# EAGLE design rotor_khamex_3.4 (EAGLE 7.6.0)

## Sheet 1 of 3
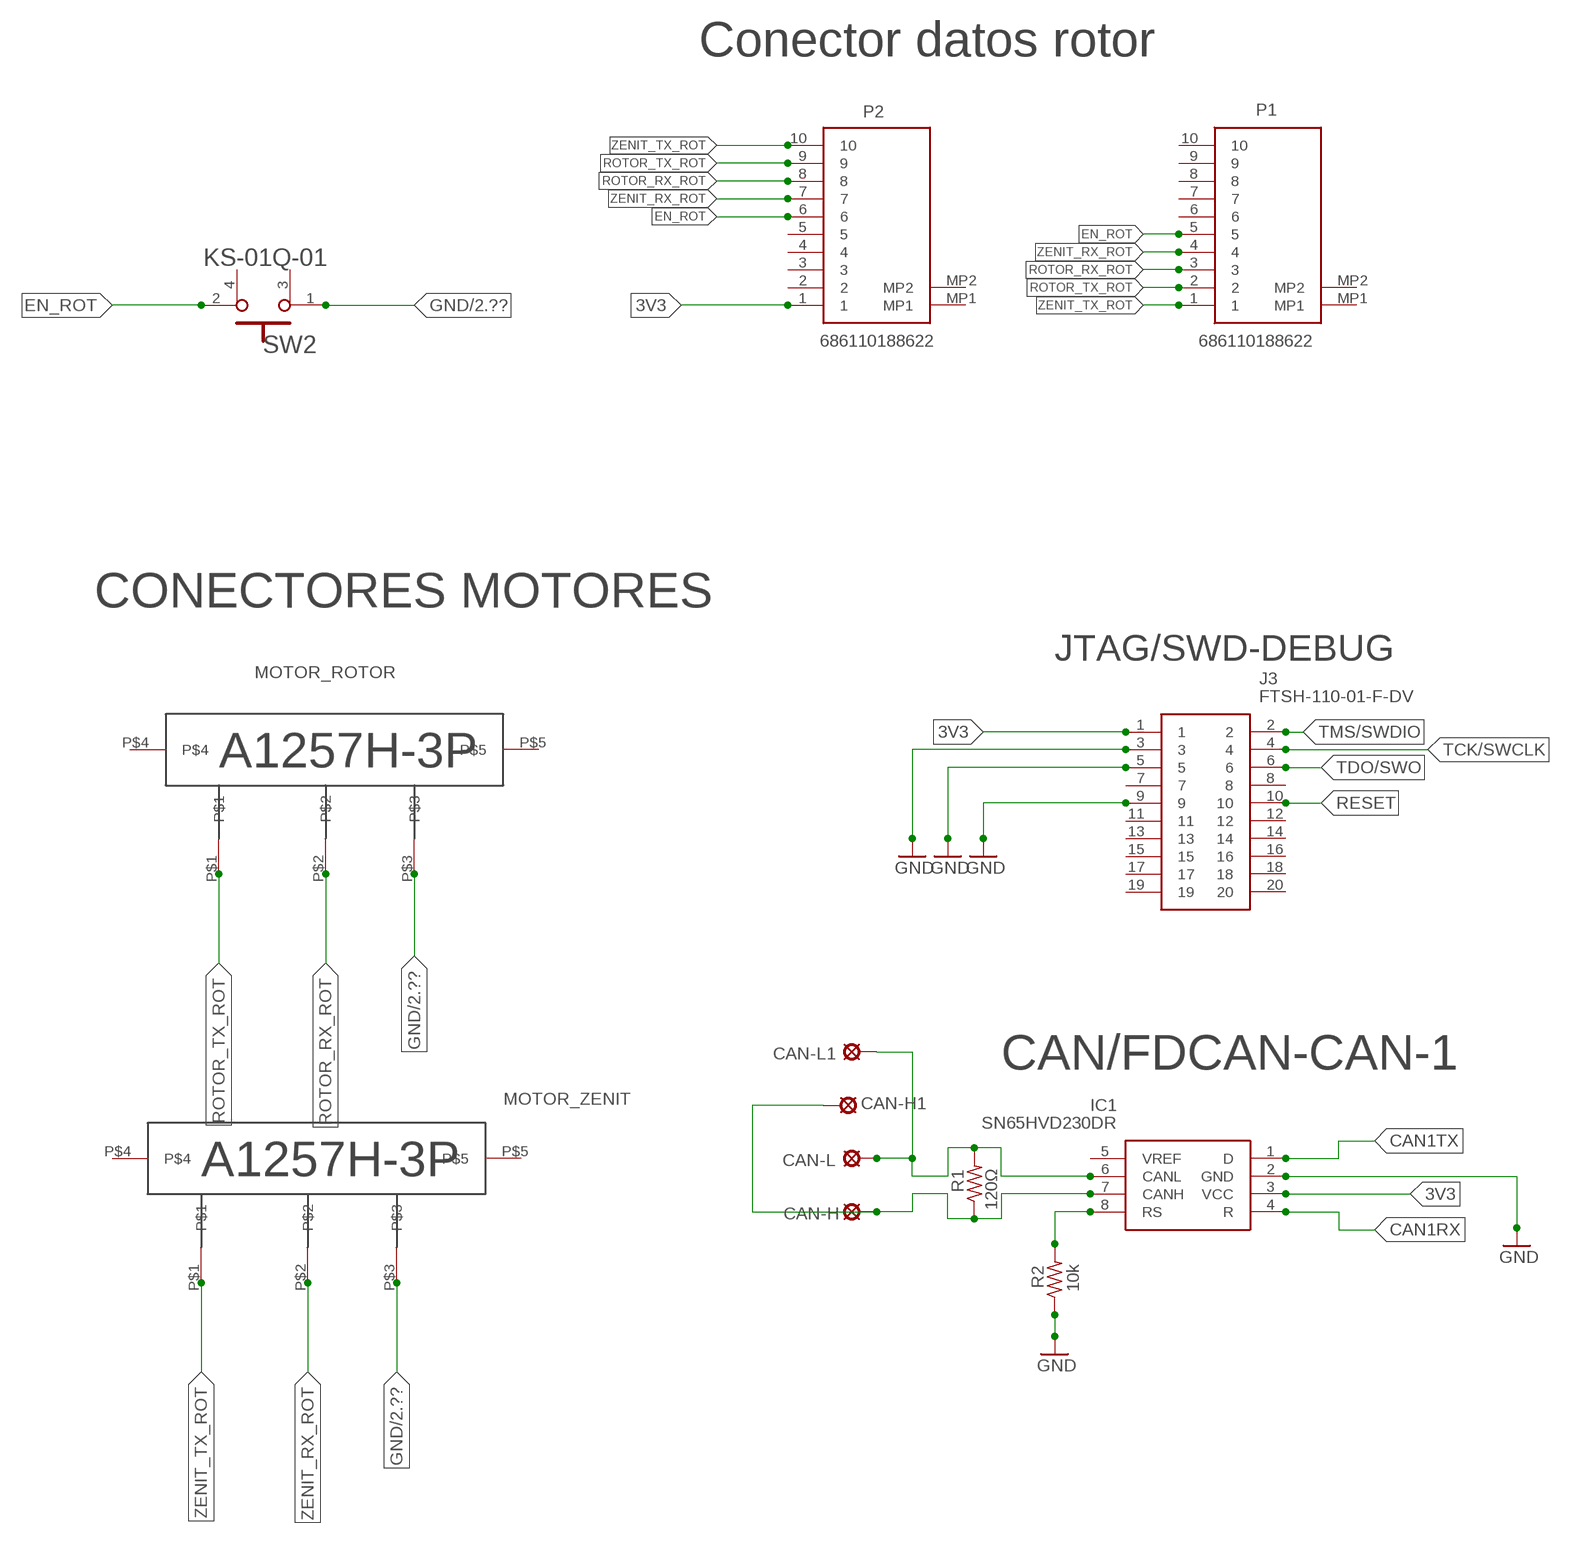
[diagram p0: schematic, sheet 1, part 1 of 2]
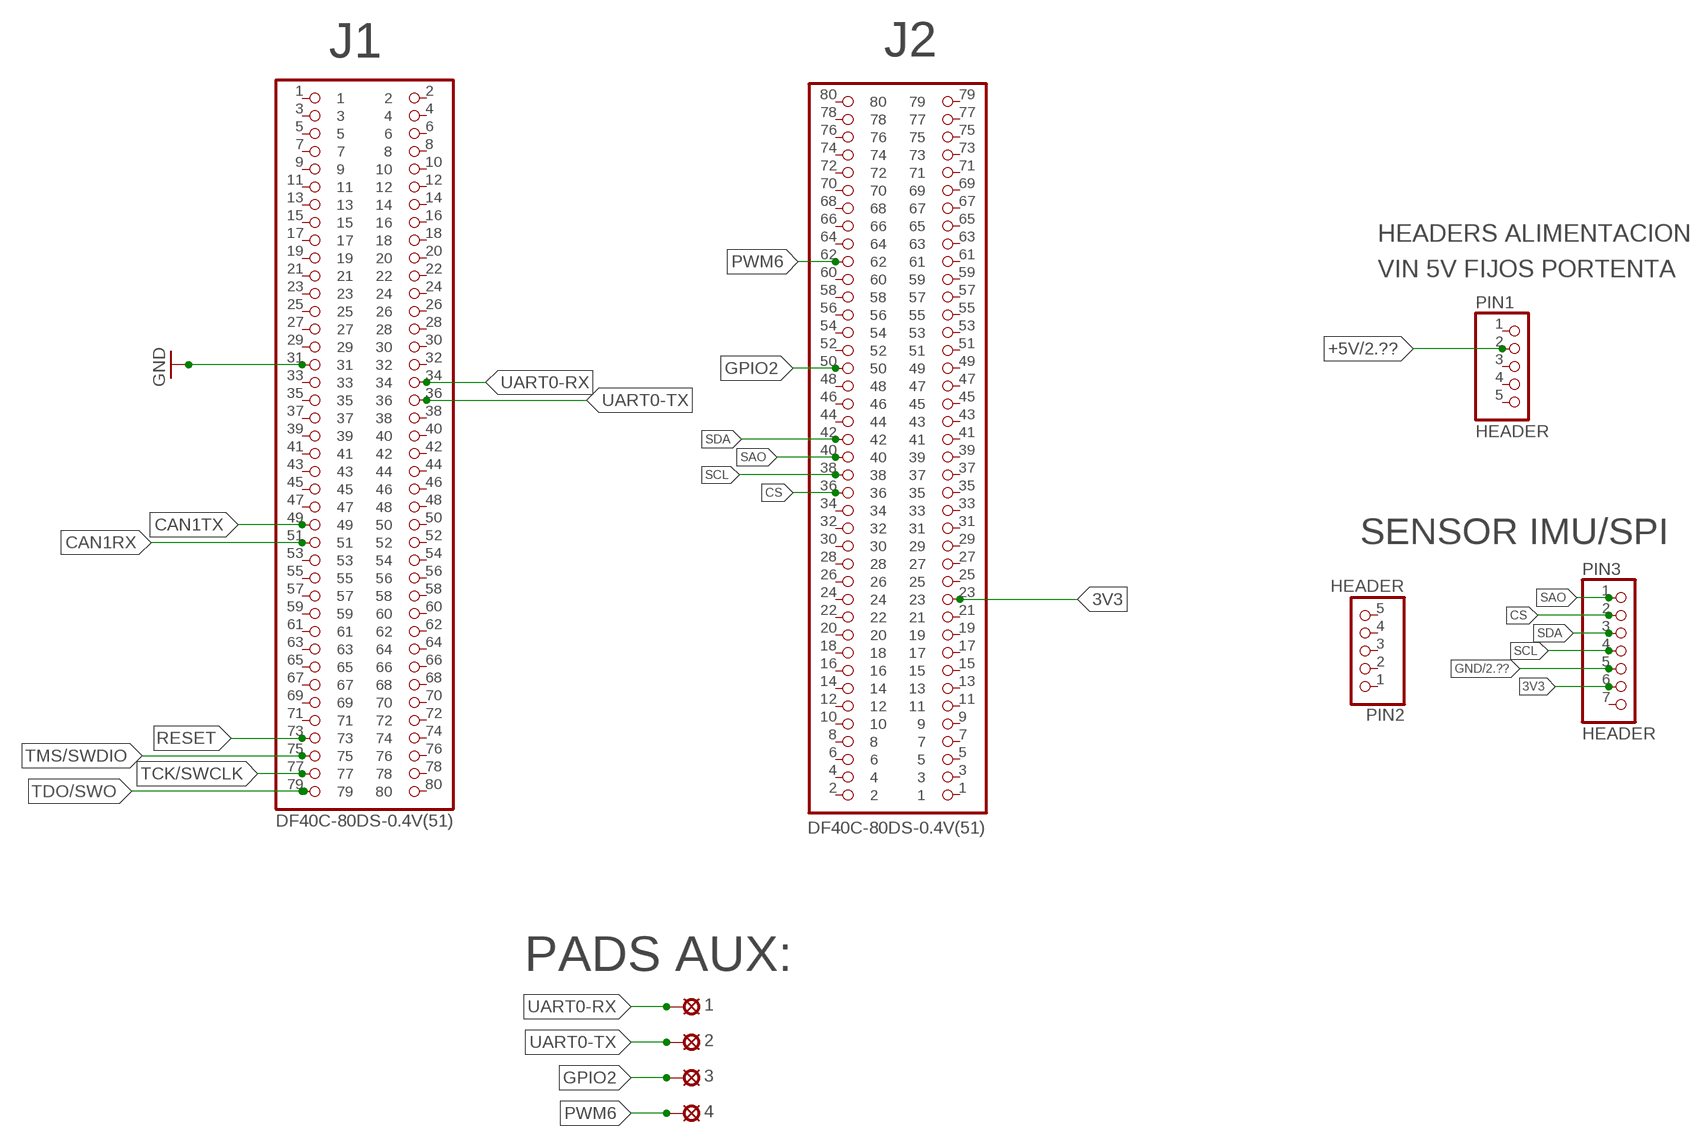
[diagram p1: schematic, sheet 1, part 2 of 2]

### Parts
1  LSP11  [LSP11]
2  LSP11  [LSP11]
3  LSP11  [LSP11]
4  LSP11  [LSP11]
CAN-H  LSP11  [LSP11]
CAN-H1  LSP11  [LSP11]
CAN-L  LSP11  [LSP11]
CAN-L1  LSP11  [LSP11]
IC1  SN65HVD230DR  [SOT127P600X175-8N]
J1  DF40C-80DS-0.4V(51)  [HRS_DF40C-80DS-0.4V(51)]
J2  DF40C-80DS-0.4V(51)  [HRS_DF40C-80DS-0.4V(51)]
J3  FTSH-110-01-F-DV  [FTSH-110-XX-YYY-DV]
MOTOR_ROTOR  A1257H-3P_DEVICE  [A1257H-3P_PACK]
MOTOR_ZENIT  A1257H-3P_DEVICE  [A1257H-3P_PACK]
P1  686110188622  [686110188622]
P2  686110188622  [686110188622]
PIN1  HEADER  PINHD-1X5  [1X05]
PIN2  HEADER  PINHD-1X5  [1X05]
PIN3  HEADER  PINHD-1X7  [1X07]
R1  120Ω  R-US_M0805  [M0805]
R2  10k  R-US_M0805  [M0805]
SW2  E-SWITCH_KS-01Q-01E-SWITCH_KS-01Q-01_0_0  [E-SWITCH_KS-01Q-01_0]

### Nets
3V3: IC1.3(VCC) J2.23 J3.1 P2.1 PIN3.6
+5V [power]: PIN1.2 ; also sheet 2
CAN1RX: IC1.4(R) J1.51
CAN1TX: IC1.1(D) J1.49
CS: J2.36 PIN3.2
EN_ROT: P1.5 P2.6 SW2.2
GND [power]: IC1.2(GND) J1.31 J3.3 J3.5 J3.9 MOTOR_ROTOR.P$3 MOTOR_ZENIT.P$3 PIN3.5 R2.1 SW2.1 ; also sheet 2
GPIO2: 3.MP J2.50
N$12: CAN-H1.MP CAN-H.MP IC1.7(CANH) R1.1
N$13: CAN-L1.MP CAN-L.MP IC1.6(CANL) R1.2
N$15: IC1.8(RS) R2.2
PWM6: 4.MP J2.62
RESET: J1.73 J3.10
ROTOR_RX_ROT: MOTOR_ROTOR.P$2 P1.3 P2.8
ROTOR_TX_ROT: MOTOR_ROTOR.P$1 P1.2 P2.9
SAO: J2.40 PIN3.1
SCL: J2.38 PIN3.4
SDA: J2.42 PIN3.3
TCK/SWCLK: J1.77 J3.4
TDO/SWO: J1.79 J3.6
TMS/SWDIO: J1.75 J3.2
UART0-RX: 1.MP J1.34
UART0-TX: 2.MP J1.36
ZENIT_RX_ROT: MOTOR_ZENIT.P$2 P1.4 P2.7
ZENIT_TX_ROT: MOTOR_ZENIT.P$1 P1.1 P2.10
Unconnected: IC1.5(VREF) J1.1 J1.2 J1.3 J1.4 J1.5 J1.6 J1.7 J1.8 J1.9 J1.10 J1.11 J1.12 J1.13 J1.14 J1.15 J1.16 J1.17 J1.18 J1.19 J1.20 J1.21 J1.22 J1.23 J1.24 J1.25 J1.26 J1.27 J1.28 J1.29 J1.30 J1.32 J1.33 J1.35 J1.37 J1.38 J1.39 J1.40 J1.41 J1.42 J1.43 J1.44 J1.45 J1.46 J1.47 J1.48 J1.50 J1.52 J1.53 J1.54 J1.55 J1.56 J1.57 J1.58 J1.59 J1.60 J1.61 J1.62 J1.63 J1.64 J1.65 J1.66 J1.67 J1.68 J1.69 J1.70 J1.71 J1.72 J1.74 J1.76 J1.78 J1.80 J2.1 J2.2 J2.3 J2.4 J2.5 J2.6 J2.7 J2.8 J2.9 J2.10 J2.11 J2.12 J2.13 J2.14 J2.15 J2.16 J2.17 J2.18 J2.19 J2.20 J2.21 J2.22 J2.24 J2.25 J2.26 J2.27 J2.28 J2.29 J2.30 J2.31 J2.32 J2.33 J2.34 J2.35 J2.37 J2.39 J2.41 J2.43 J2.44 J2.45 J2.46 J2.47 J2.48 J2.49 J2.51 J2.52 J2.53 J2.54 J2.55 J2.56 J2.57 J2.58 J2.59 J2.60 J2.61 J2.63 J2.64 J2.65 J2.66 J2.67 J2.68 J2.69 J2.70 J2.71 J2.72 J2.73 J2.74 J2.75 J2.76 J2.77 J2.78 J2.79 J2.80 J3.7 J3.8 J3.11 J3.12 J3.13 J3.14 J3.15 J3.16 J3.17 J3.18 J3.19 J3.20 MOTOR_ROTOR.P$4 MOTOR_ROTOR.P$5 MOTOR_ZENIT.P$4 MOTOR_ZENIT.P$5 P1.6 P1.7 P1.8 P1.9 P1.10 P1.MP1 P1.MP2 P2.2 P2.3 P2.4 P2.5 P2.MP1 P2.MP2 PIN1.1 PIN1.3 PIN1.4 PIN1.5 PIN2.1 PIN2.2 PIN2.3 PIN2.4 PIN2.5 PIN3.7 SW2.3 SW2.4

### Notes on the sheet
- Conector datos rotor
- HEADERS ALIMENTACION
- VIN 5V FIJOS PORTENTA
- SENSOR IMU/SPI
- CONECTORES MOTORES
- JTAG/SWD-DEBUG
- MOTOR_ROTOR
- PADS AUX:
- CAN/FDCAN-CAN-1
- MOTOR_ZENIT

## Sheet 2 of 3
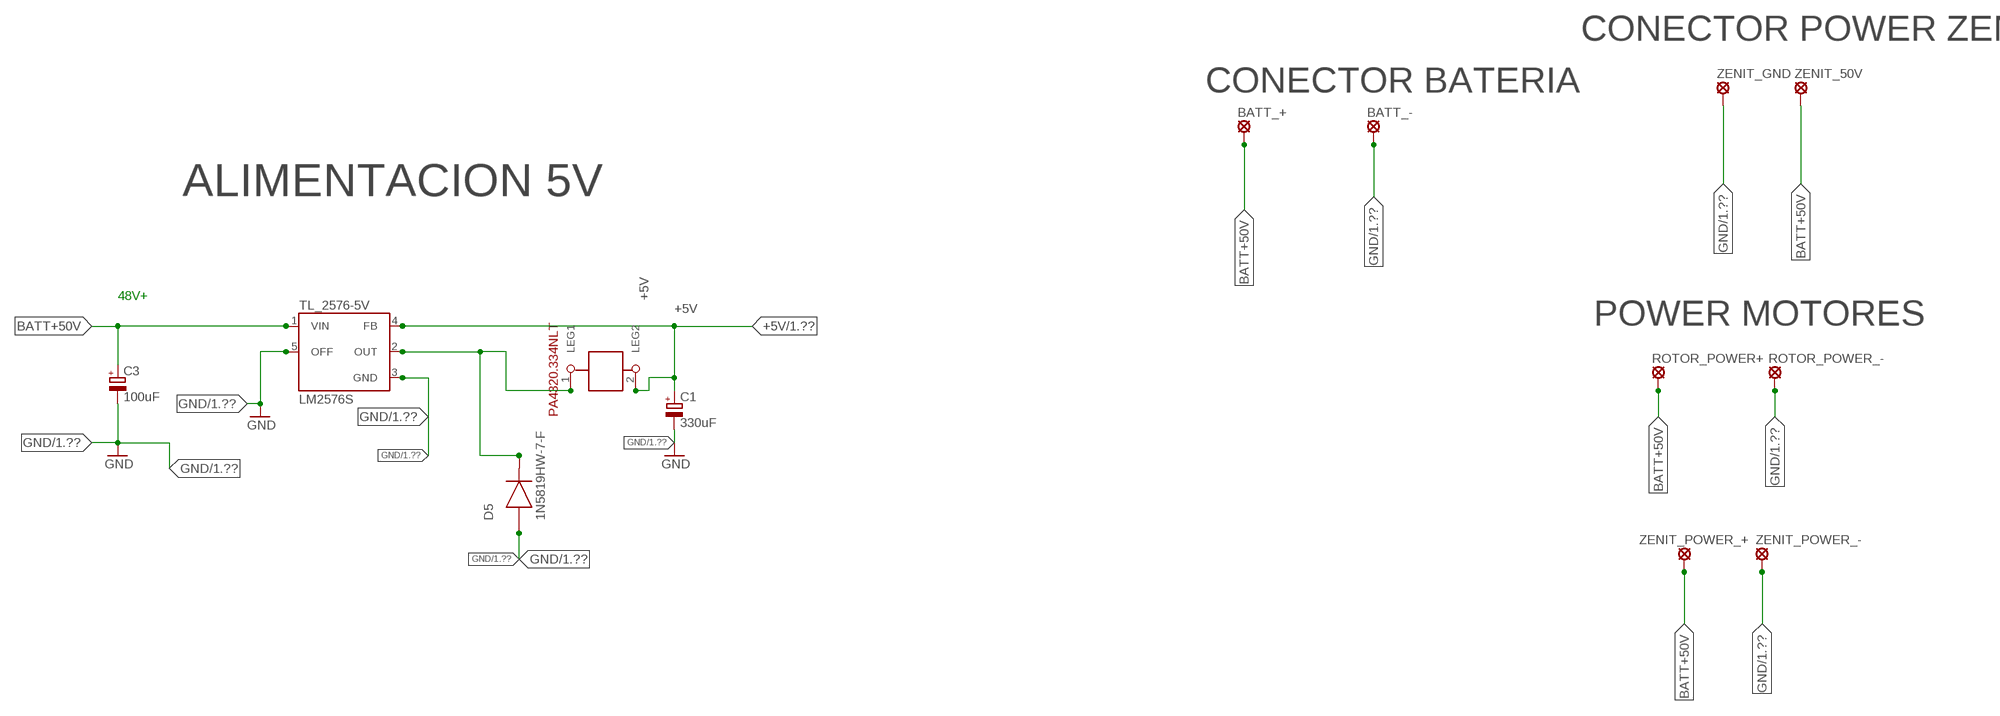
[diagram p2: schematic, sheet 2]

### Parts
BATT_+  SE14  [SE14]
BATT_-  SE14  [SE14]
C1  330uF  CPOL-EUE5-10.5  [E5-10,5]
C3  100uF  CPOL-EUE5-10.5  [E5-10,5]
D5  1N5819HW-7-F  [SOD370155X135]
L  1212  [1212SMDINDUCTORPACK]
ROTOR_POWER+  SE14  [SE14]
ROTOR_POWER_-  SE14  [SE14]
TL_2576-5V  LM2576S  [TO263-5]
ZENIT_50V  SE14  [SE14]
ZENIT_GND  SE14  [SE14]
ZENIT_POWER_+  SE14  [SE14]
ZENIT_POWER_-  SE14  [SE14]

### Nets
+5V [power]: C1.+ L.2(LEG2) TL_2576-5V.4(FB) ; also sheet 1
BATT+50V [power]: BATT_+.MP C3.+ D5.1(C) L.1(LEG1) ROTOR_POWER+.MP TL_2576-5V.1(VIN) TL_2576-5V.2(OUT) ZENIT_50V.MP ZENIT_POWER_+.MP
GND [power]: BATT_-.MP C1.- C3.- D5.2(A) ROTOR_POWER_-.MP TL_2576-5V.3(GND) TL_2576-5V.5(OFF) ZENIT_GND.MP ZENIT_POWER_-.MP ; also sheet 1

### Notes on the sheet
- CONECTOR POWER ZENIT
- CONECTOR BATERIA
- ALIMENTACION 5V
- 48V+
- POWER MOTORES

## Sheet 3 of 3

## Library data of the parts
1-4 CAN-H CAN-H1 CAN-L CAN-L1 = solpad:LSP11: SOLDER PAD drill 1.1 mm
BATT_+ BATT_- ROTOR_POWER+ ROTOR_POWER_- ZENIT_50V ZENIT_GND ZENIT_POWER_+ ZENIT_POWER_- = solpad:SE14: SOLDER PAD E1553, drill 1,4mm, distributor Buerklin, 07F820
C1 C3 = rcl:CPOL-EU: POLARIZED CAPACITOR, European symbol
D5 = 1N5819HW-7-F:1N5819HW-7-F: 1N5819HW Series 40 V 1 A Surface Mount Schottky Barrier Rectifier - SOD-123; DESCRIPTION: 1N5819HW Series 40 V 1 A Surface Mount Schottky Barrier Rectifier - SOD-123; DIGI-KEY_PART_NUMBER: 1N5819HW-FDICT-ND; DIGI-KEY_PURCHASE_URL: https://www.digikey.es/product-detail/en/diodes-incorporated/1N5819HW-7-F/1N5819HW-FDICT-ND/815283?utm_source=snapeda&utm_medium=aggregator&utm_campaign=symbol; MF: Diodes Inc.; MP: 1N5819HW-7-F; PACKAGE: SOD-123 Diodes Inc.
IC1 = SN65HVD230DR:SN65HVD230DR: 3.3 V CAN Transceiver with Standby Mode Source: Datasheet <http://www.ti.com/lit/gpn/sn65hvd230>; DESCRIPTION: 3.3 V CAN Transceiver with Standby Mode; HEIGHT: 1.75mm; MANUFACTURER_NAME: Texas Instruments; MANUFACTURER_PART_NUMBER: SN65HVD230DR; MOUSER_PART_NUMBER: 595-SN65HVD230DR; MOUSER_PRICE-STOCK: https://www.mouser.co.uk/ProductDetail/Texas-Instruments/SN65HVD230DR?qs=QViXGNcIEAtifeQR3pYVUQ%3D%3D
J1 J2 = DF40C-80DS-0.4V_51_(1):DF40C-80DS-0.4V(51); CHECK_PRICES: https://www.snapeda.com/parts/DF40C-80DS-0.4V(51)/Hirose/view-part/?ref=eda; DESCRIPTION: Receptáculo del conector de la posición 80, contactos de la tira central Montaje en superficie Oro; DIGIKEY_PART_NUMBER: H11633CT-ND; MF: Hirose; MP: DF40C-80DS-0.4V(51); PACKAGE: None; SNAPEDA_LINK: https://www.snapeda.com/parts/DF40C-80DS-0.4V(51)/Hirose/view-part/?ref=snap
J3 = FTSH-110-01-F-DV:FTSH-110-01-F-DV: 20 Position, High Reliability Header Strips, 0.050" pitch Source: Datasheet <http://suddendocs.samtec.com/prints/ftsh-1xx-xx-xxx-dv-xxx-xxx-mkt.pdf>; DESCRIPTION: 20 Position, High Reliability Header Strips, 0.050&quot; pitch; HEIGHT: mm; MANUFACTURER_NAME: SAMTEC; MANUFACTURER_PART_NUMBER: FTSH-110-01-F-DV; MOUSER_PART_NUMBER: 200-FTSH11001FDV; MOUSER_PRICE-STOCK: https://www.mouser.co.uk/ProductDetail/Samtec/FTSH-110-01-F-DV?qs=92ilVni64gw1JaTDl9rCLg%3D%3D
L = smd 1212 inductor:1212
MOTOR_ROTOR MOTOR_ZENIT = A1257H-3P:A1257H-3P_DEVICE
P1 P2 = 686110188622:686110188622: FFC & FPC Connectors WR-FPC 1,0mm SMT Horiz. Top Contact Tin Plating{0000} Source: Datasheet <https://www.mouser.ch/datasheet/2/445/686110188622-1843591.pdf>; DESCRIPTION: FFC & FPC Connectors WR-FPC 1,0mm SMT Horiz. Top Contact Tin Plating{0000}; HEIGHT: 3.3mm; MANUFACTURER_NAME: Wurth Elektronik; MANUFACTURER_PART_NUMBER: 686110188622; MOUSER_PART_NUMBER: 710-686110188622; MOUSER_PRICE-STOCK: https://www.mouser.co.uk/ProductDetail/Wurth-Elektronik/686110188622?qs=OlC7AqGiEDnHUpT6yh27Lg%3D%3D
PIN1 PIN2 = pinhead:PINHD-1X5: PIN HEADER
PIN3 = pinhead:PINHD-1X7: PIN HEADER
R1 R2 = rcl:R-US_: RESISTOR, American symbol
SW2 = E-Switch - KS-01Q-01:E-SWITCH_KS-01Q-01: Pushbutton Switch SPST-NO Standard Through Hole; ACTUATOR_TYPE: Round, Button; CAPACITANCE: 1.0pF; CURRENT_RATING: 10mA (DC); DATASHEET: https://upverter.com/datasheet/3b708556f29b55c7f5db677c77a74973be95ebea.pdf; DIGIKEY_DESCRIPTION: SWITCH Pushbutton Switch SPST-NO Standard Through Hole; DIGIKEY_PART_NUMBER: EG4791-ND; ELECTRICAL_LIFE: 250,000 Cycles; IMPORTED_FROM: octopart; LEAD_FREE: yes; MECHANICAL_LIFE: 500,000 Cycles; MF: E-Switch; MFG_PACKAGE_IDENT: 29-KS01Q01; MOUSER_PART_NUMBER: 612-KS-01Q-01; MPN: KS-01Q-01; NUM_PINS: 4; OCTOPART_PART_NUMBER: 72a6bab923faad61; PACKAGE: SW_PTH_12MM; PREFIX: SW; ROHS: yes; TEMPERATURE_RANGE_HIGH: +85°C; TEMPERATURE_RANGE_LOW: -20°C; VOLTAGE_RATING_-_DC: 35V; VOLTAGE_RATING_AC: 35 V
TL_2576-5V = v-reg-3:LM2576: National Semiconductor <http://www.national.com> 3.0A "Simple Switcher"(c) 52kHz, Vout 1.23-37V (HV: 57V), Vin 40V (HV: 60V), 50µA standby current

## Net classes
0 default: width 0.152 mm, drill 0.305 mm, clearance 0.152 mm
1 power: width 0.127 mm, drill 0.305 mm, clearance 0.127 mm
2 thin: width 0.508 mm, drill 0.305 mm, clearance 0.152 mm

## Board
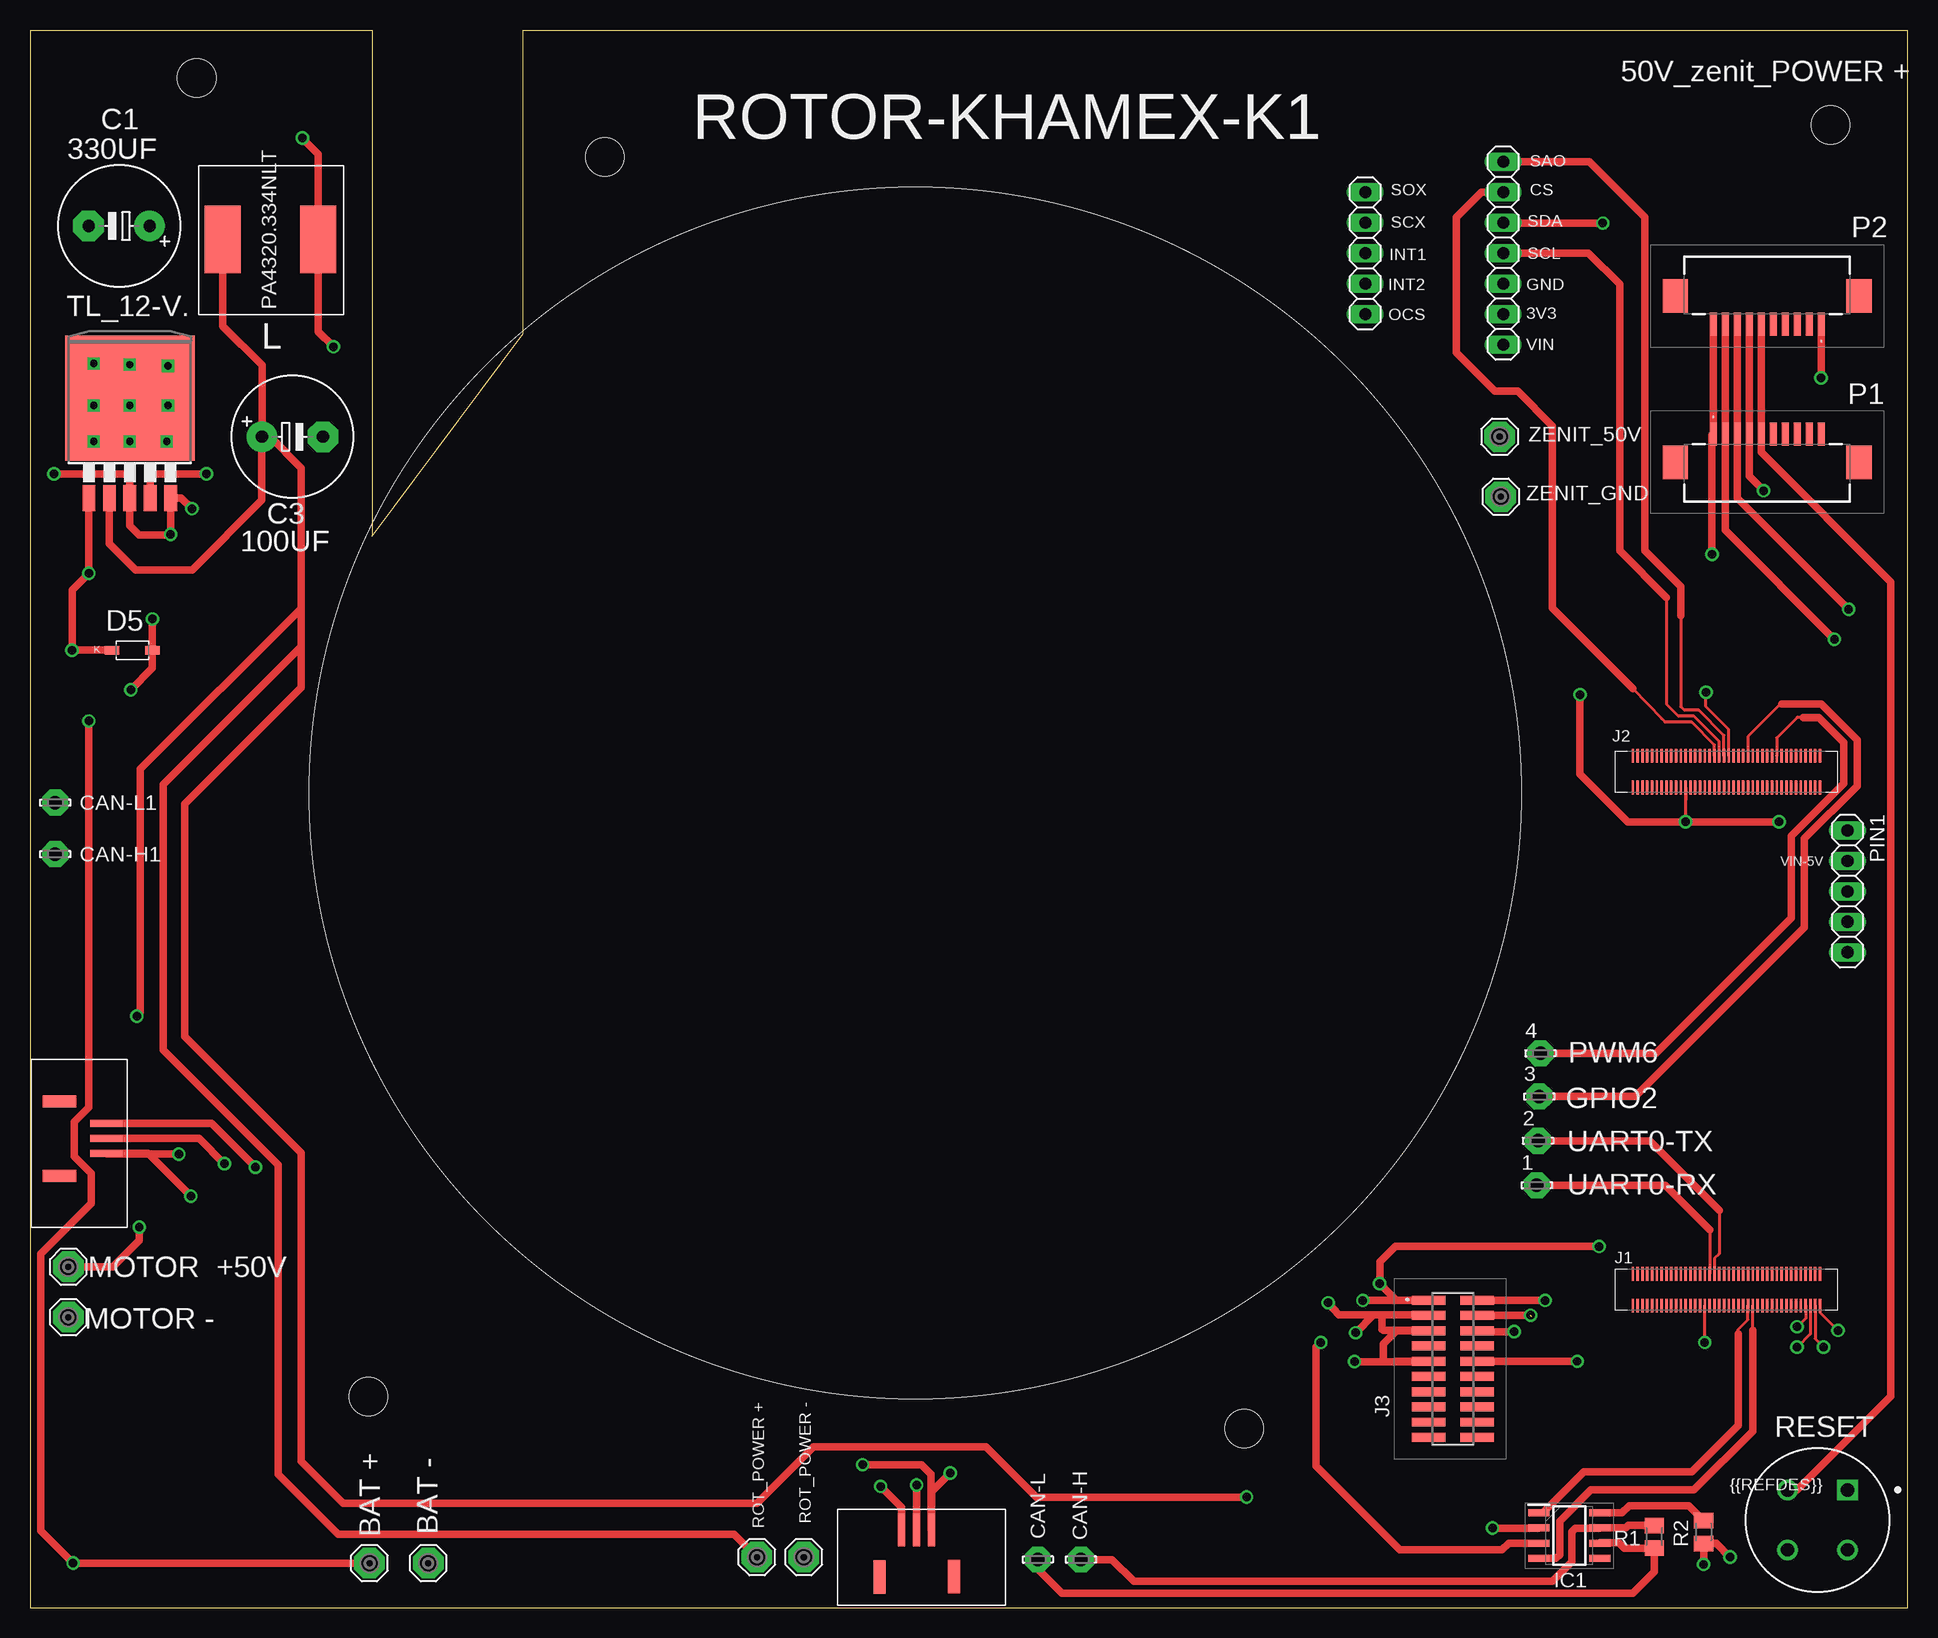
[diagram p3: board, top side]
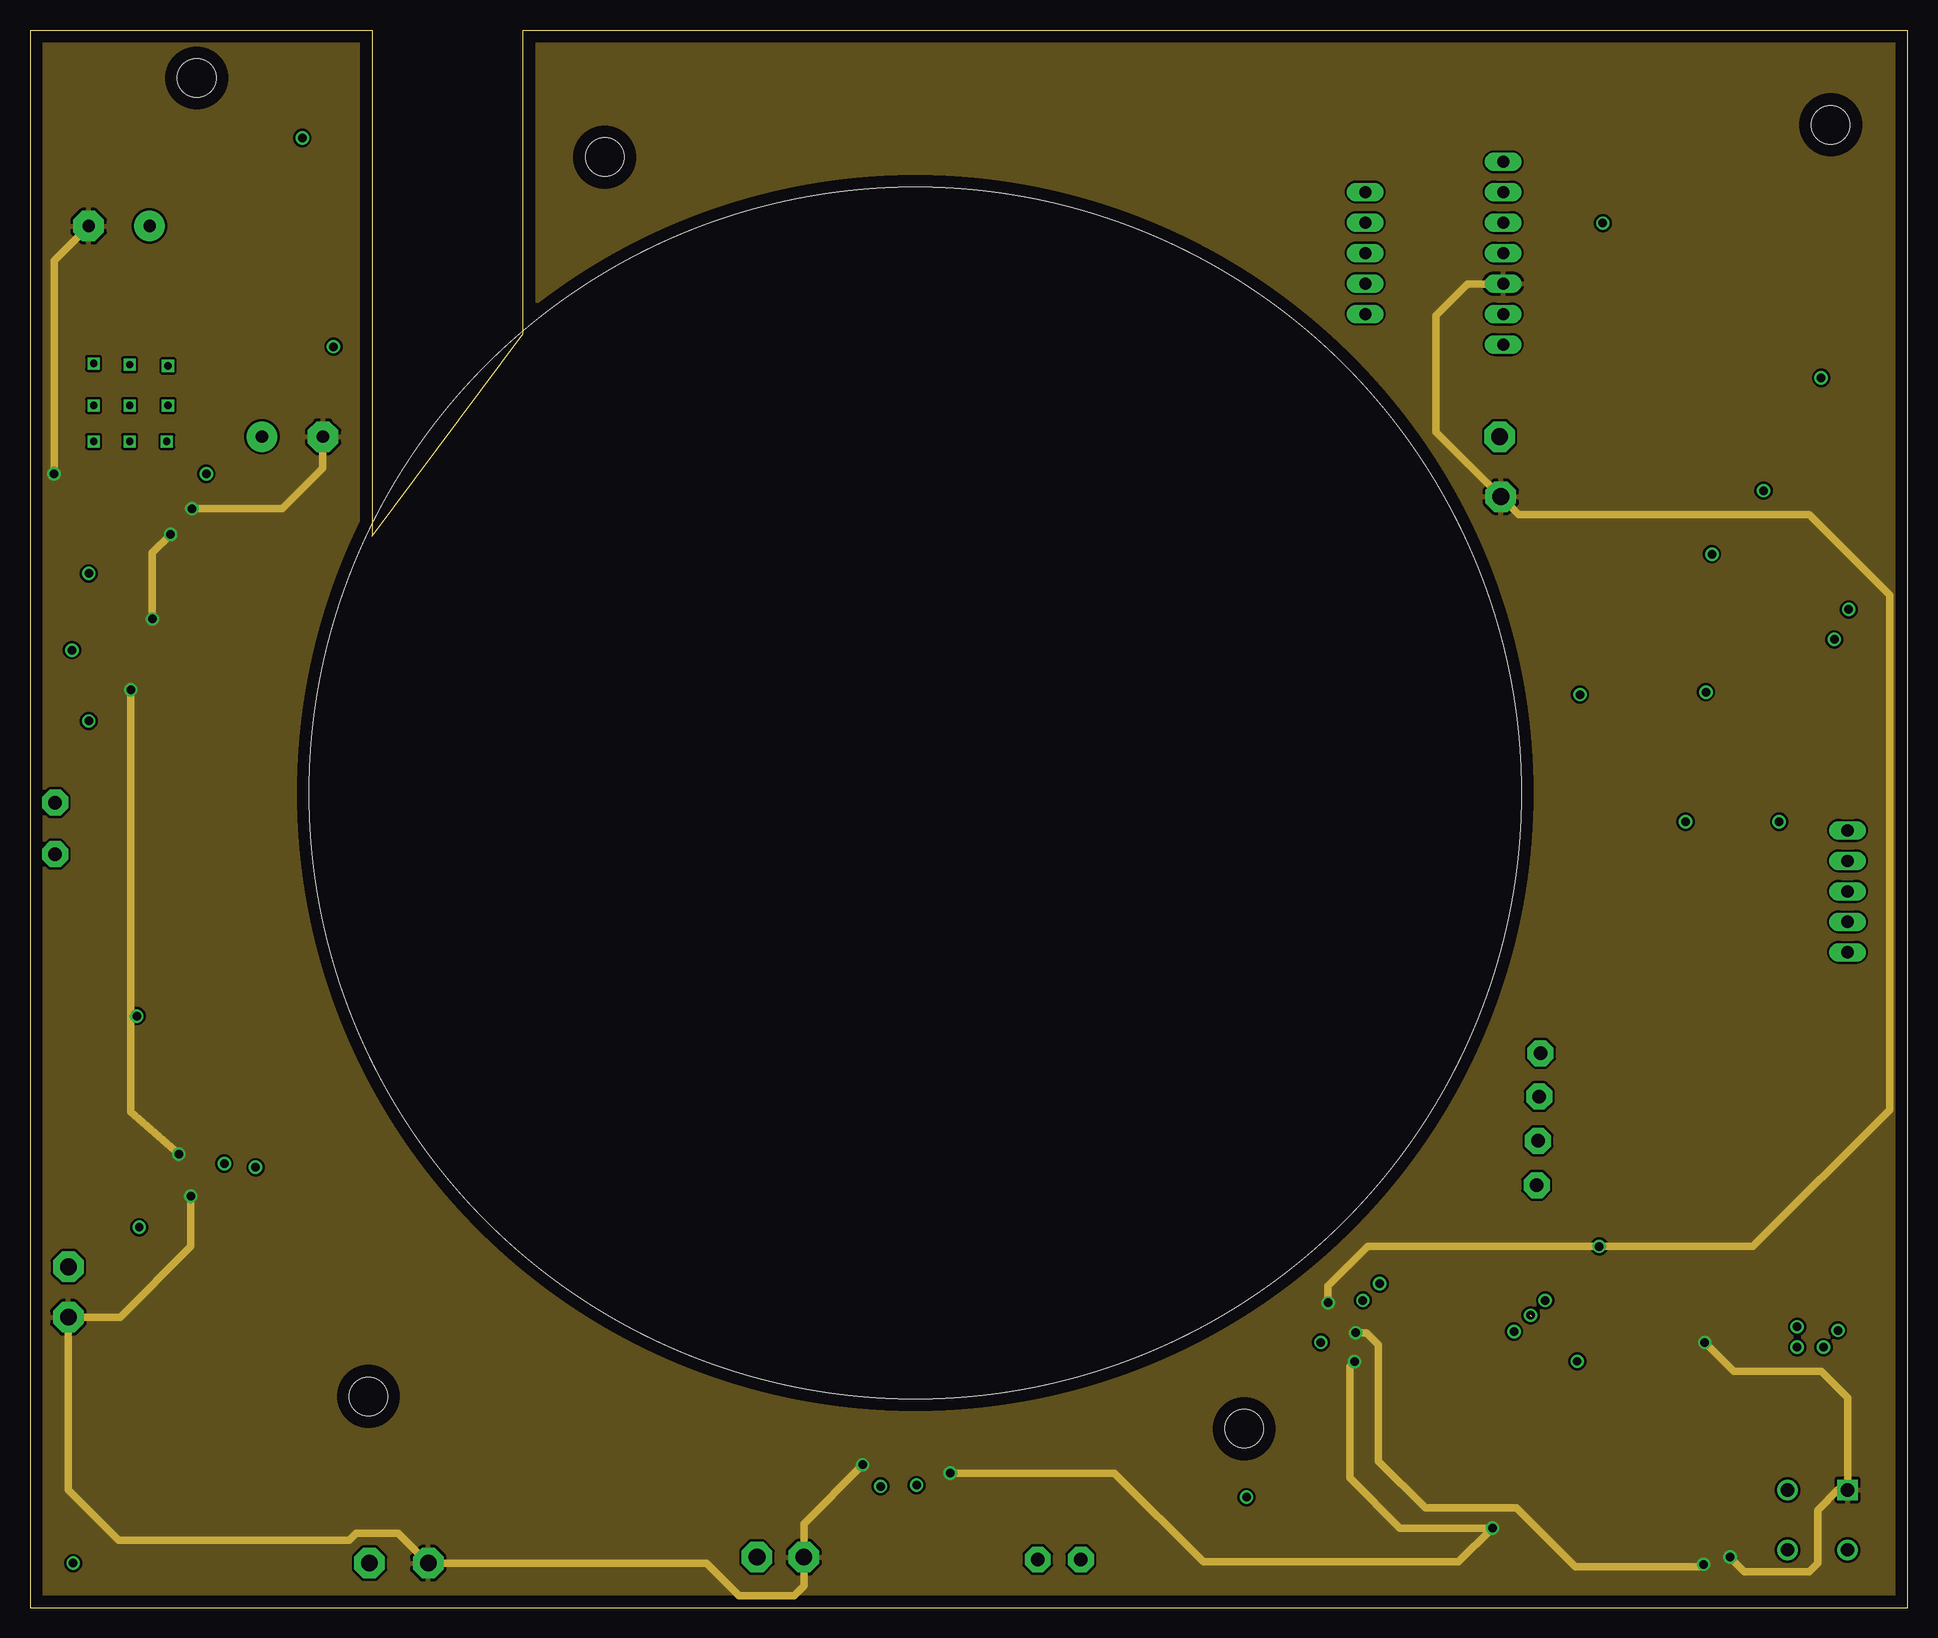
[diagram p4: board, inner layer Route2]
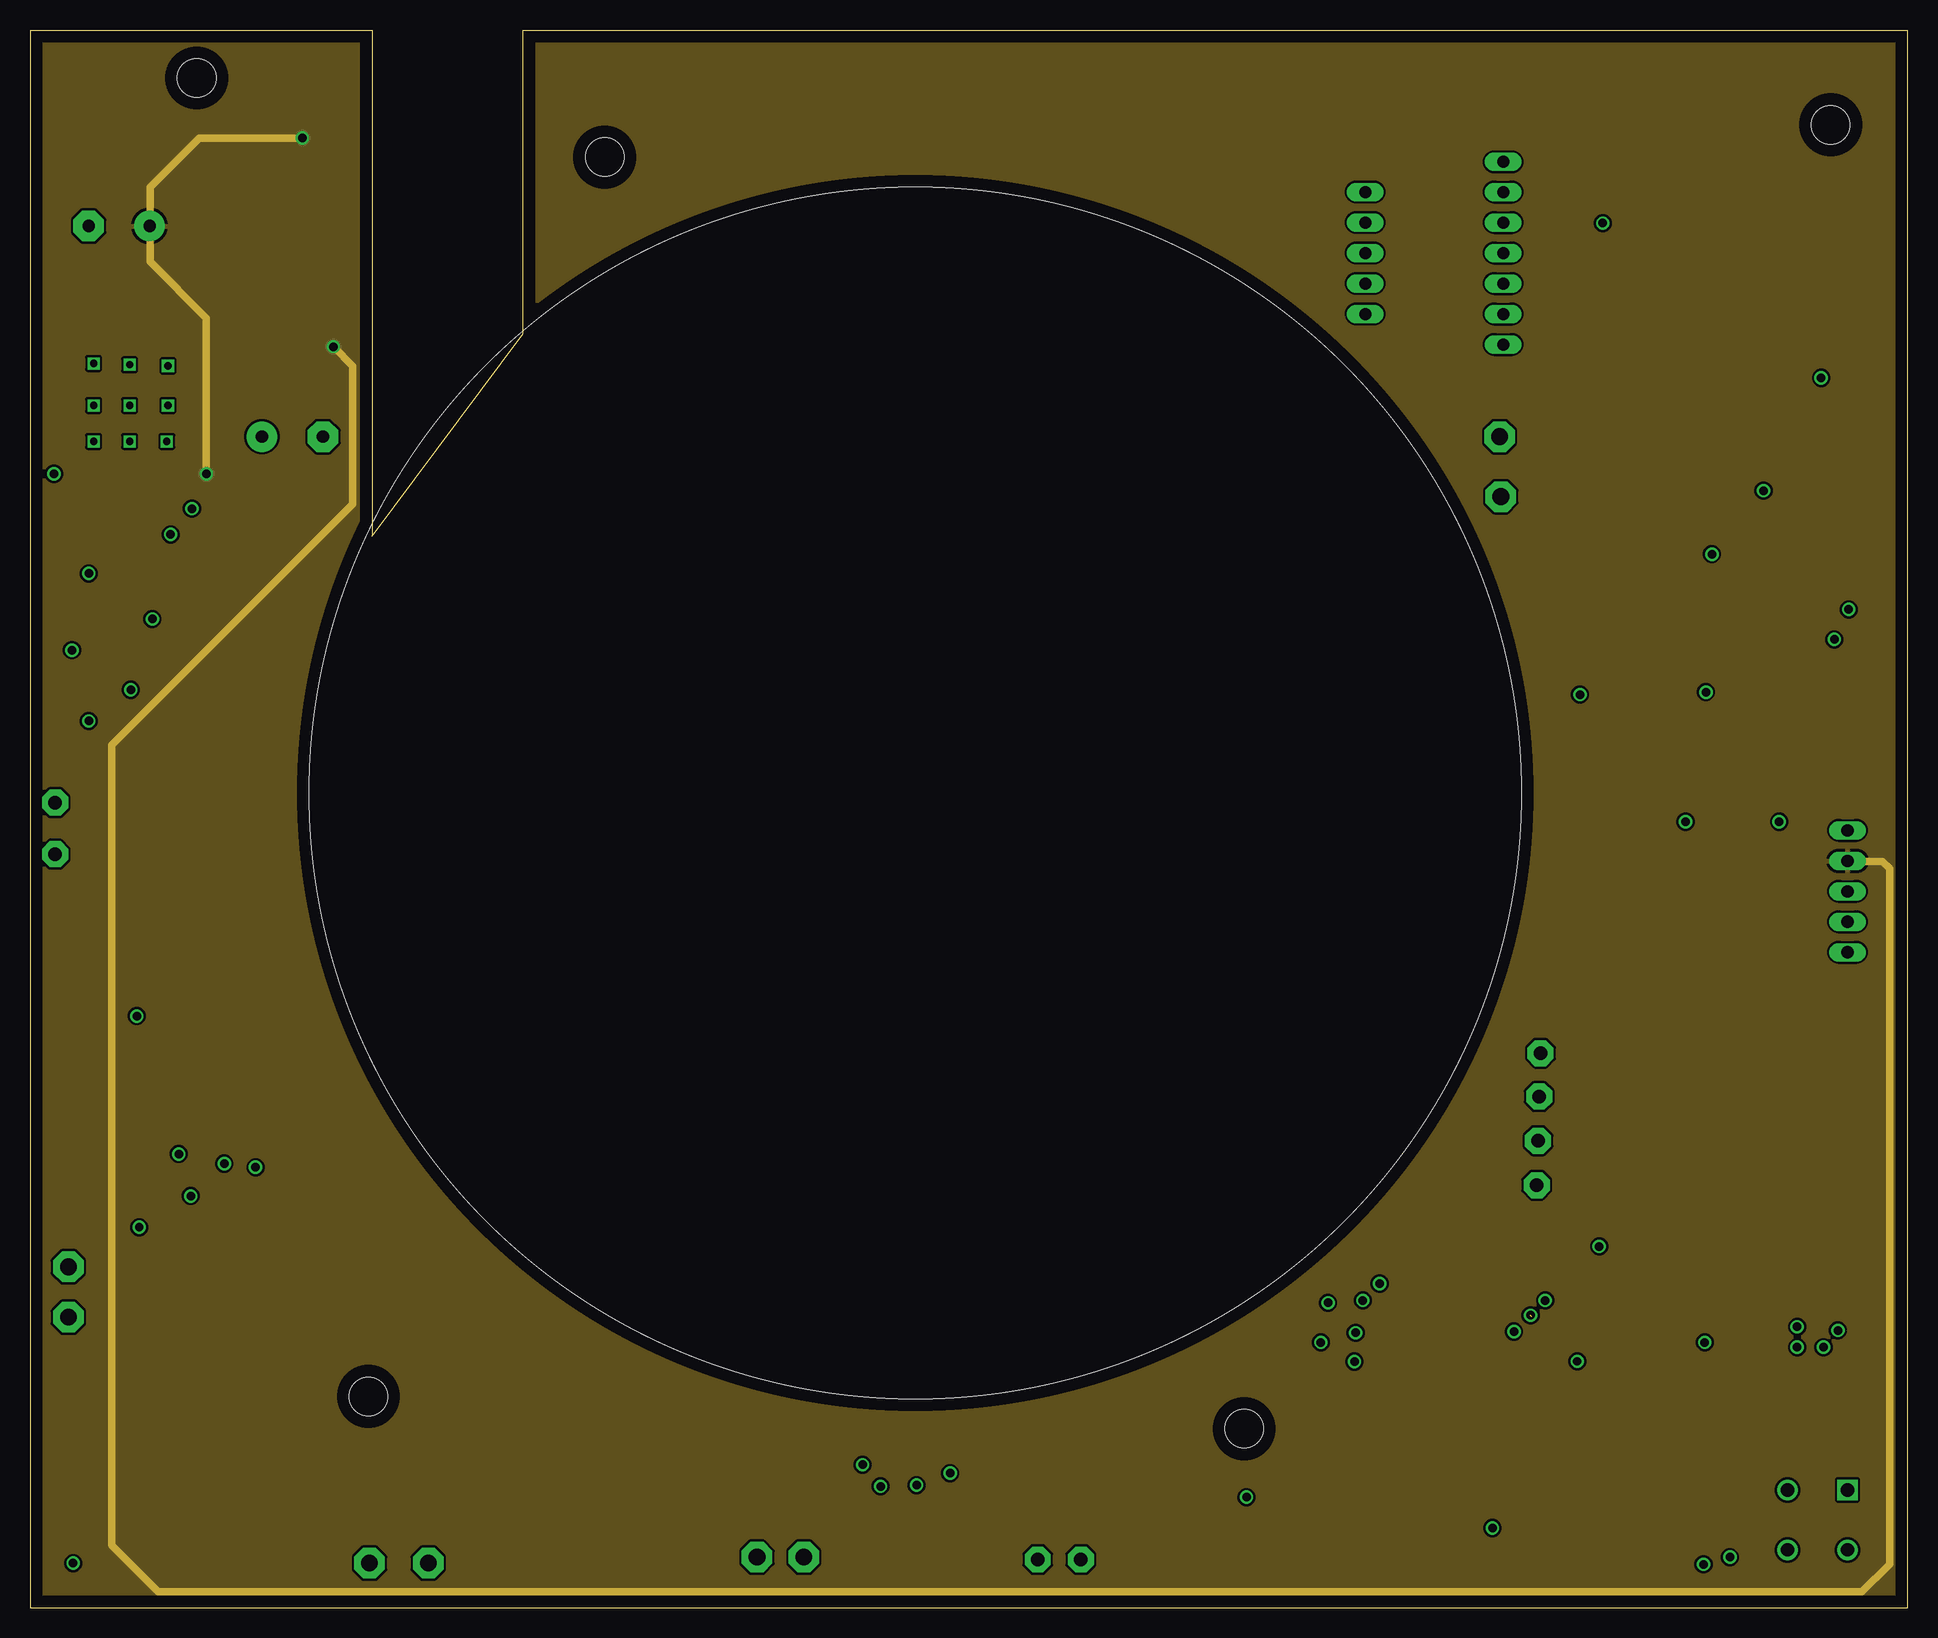
[diagram p5: board, inner layer Route15]
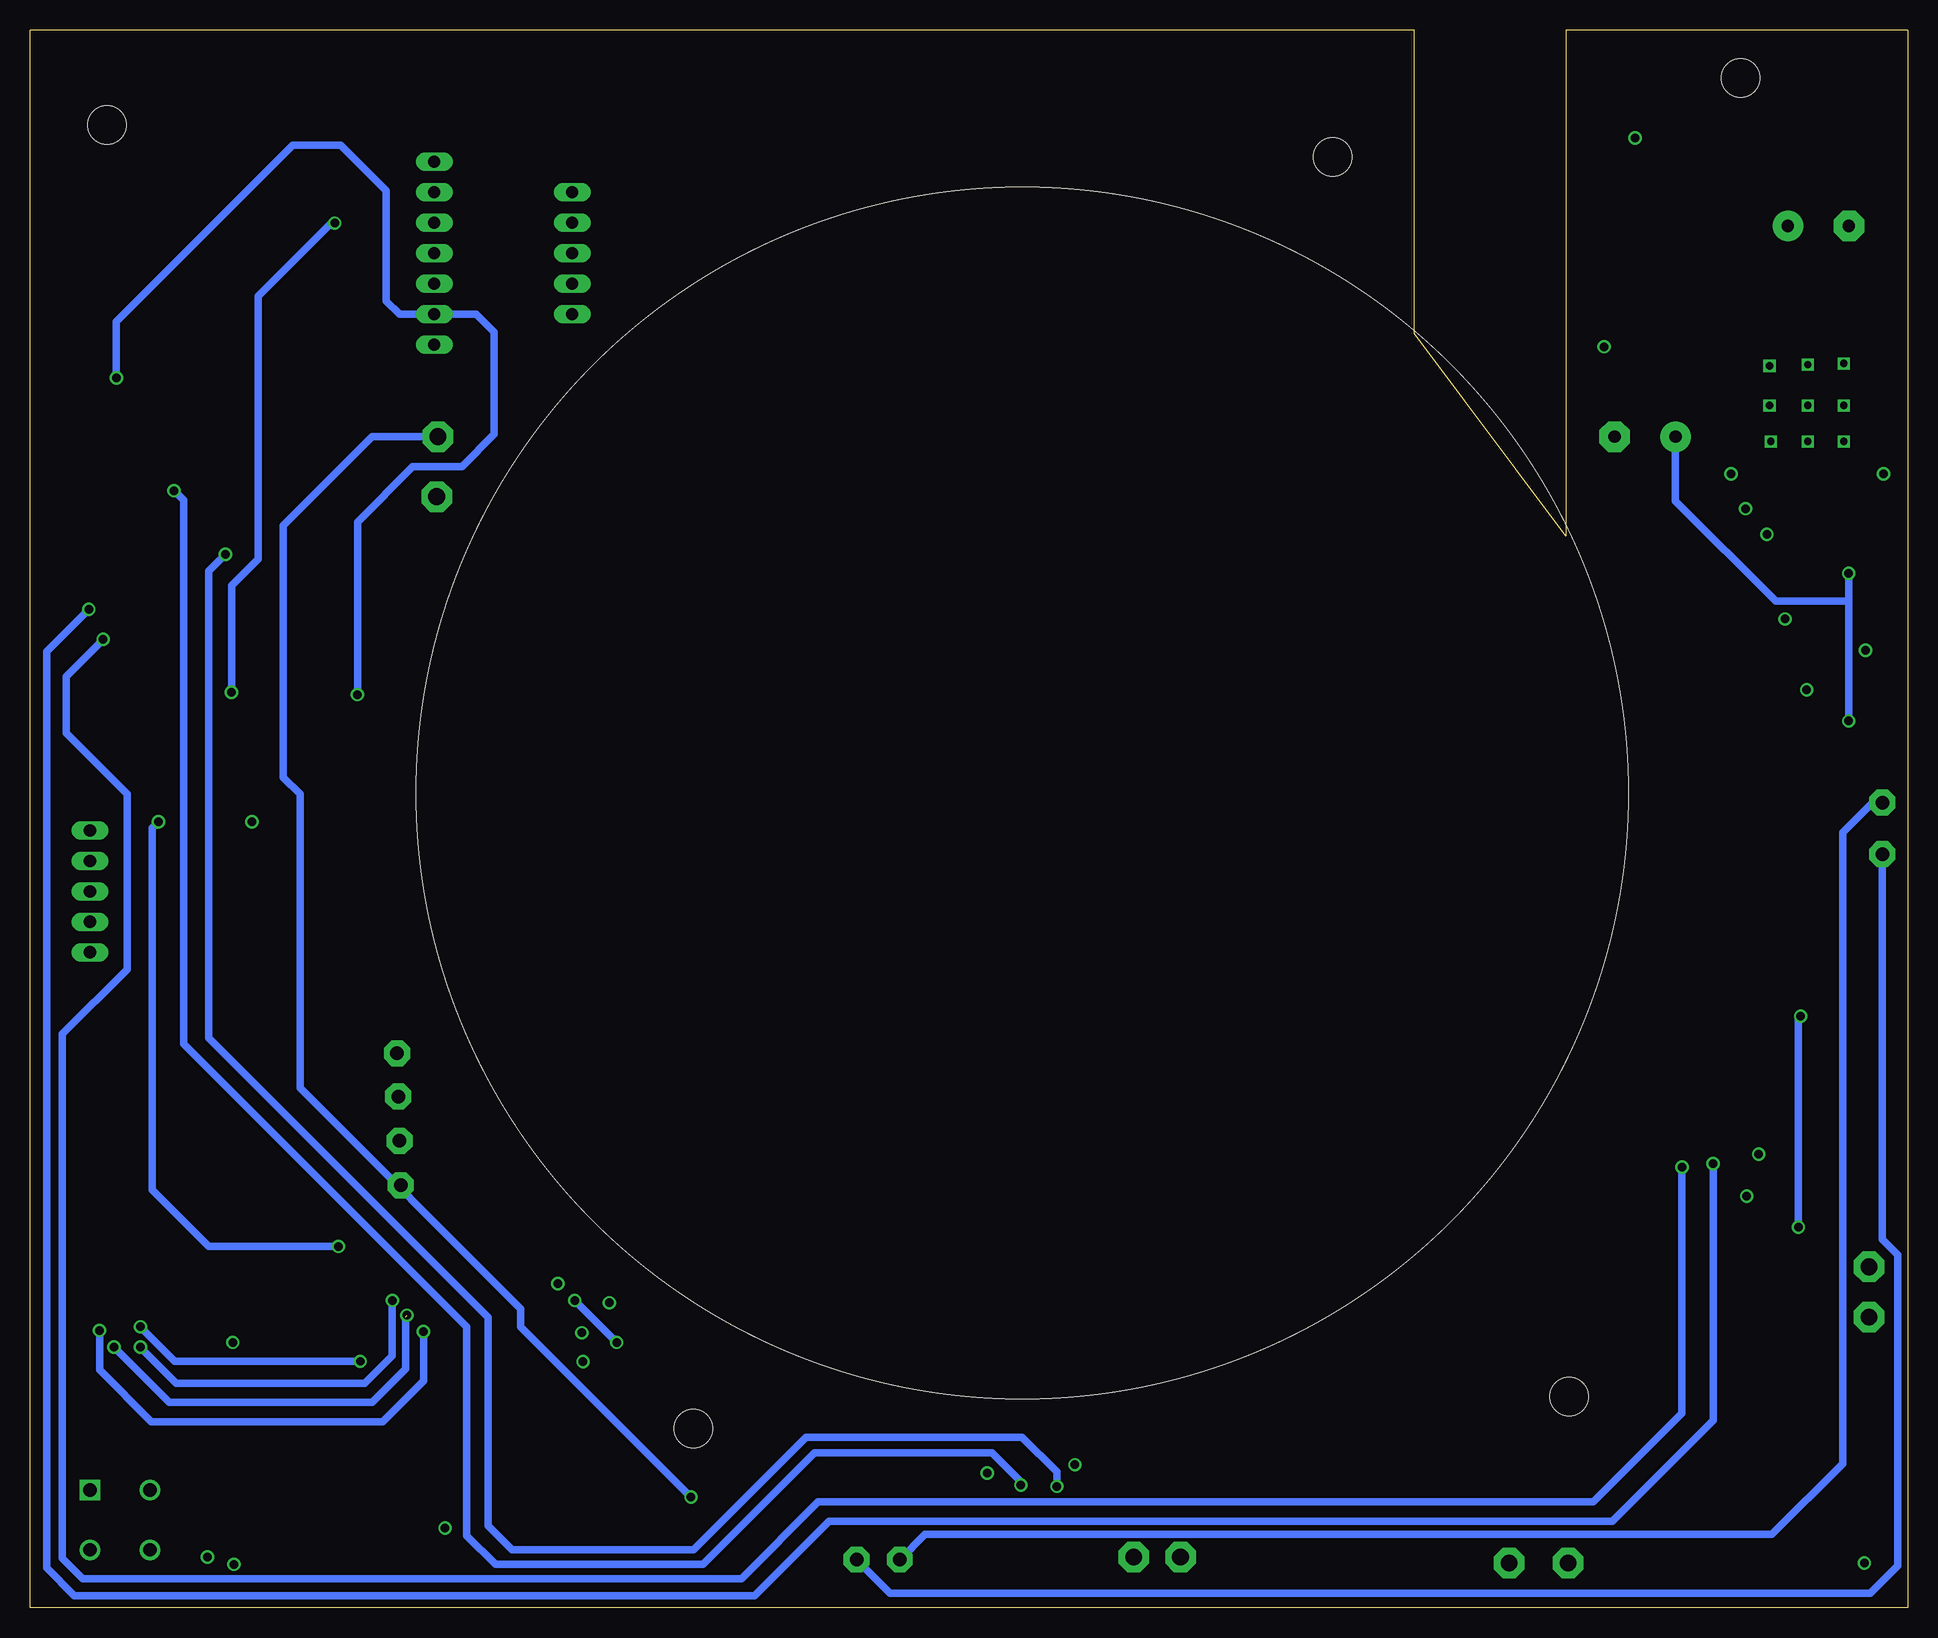
[diagram p6: board, bottom side, seen from below]

Size 156.5 x 131.5 mm. Coordinates in mm from the lower left corner, seen from the top.
Outline: 0,0 156.5,0 156.5,131.5 41.1,131.5 41.1,106.2 28.5,89.3 28.5,131.5 0,131.5 0,0
Copper layers (1*16): Top 0.035mm / dielectric 1.5mm / Bottom 0.035mm
Design rules "default": minimum track width 10mil, minimum drill 24mil, track to track 8mil, track to pad 8mil, pad to pad 8mil, via to via 8mil, smd to smd 8mil, copper to edge 40mil, drill to drill 8mil, minimum pad ring 10mil, minimum via ring 8mil, stop-mask expansion 4mil, vias tented up to drill 0mil, thermal gap 10mil
Holes 101 mm at 73.8,67.9
Holes 3.2 mm at 101.2,14.9 150.1,123.6 28.2,17.6 13.9,127.5 47.9,120.9

### Footprints (pad centres in the part's own frame; a part is rotated, then mirrored left to right if it is on the bottom)
LSP11 = drill 1.118 pad 2.159 octagon: MP 0,0
SE14 = drill 1.397 pad 2.54 octagon: MP 0,0
E5-10,5 = drill 1.016 pad 2.54: + -2.54,0 | drill 1.016 pad 2.54 octagon: - 2.54,0
SOD370155X135 = smd 1.21 x 0.73: 1 -1.68,0; 2 1.68,0
SOT127P600X175-8N = smd 1.75 x 0.6: 1 -2.55,1.905; 2 -2.55,0.635; 3 -2.55,-0.635; 4 -2.55,-1.905; 5 2.55,-1.905; 6 2.55,-0.635; 7 2.55,0.635; 8 2.55,1.905
HRS_DF40C-80DS-0.4V(51) = smd 0.2 x 1.14: 1 -7.8,-1.32; 2 -7.8,1.32; 3 -7.4,-1.32; 4 -7.4,1.32; 5 -7,-1.32; 6 -7,1.32; 7 -6.6,-1.32; 8 -6.6,1.32; 9 -6.2,-1.32; 10 -6.2,1.32; 11 -5.8,-1.32; 12 -5.8,1.32; 13 -5.4,-1.32; 14 -5.4,1.32; 15 -5,-1.32; 16 -5,1.32; 17 -4.6,-1.32; 18 -4.6,1.32; 19 -4.2,-1.32; 20 -4.2,1.32; 21 -3.8,-1.32; 22 -3.8,1.32; 23 -3.4,-1.32; 24 -3.4,1.32; 25 -3,-1.32; 26 -3,1.32; 27 -2.6,-1.32; 28 -2.6,1.32; 29 -2.2,-1.32; 30 -2.2,1.32; 31 -1.8,-1.32; 32 -1.8,1.32; 33 -1.4,-1.32; 34 -1.4,1.32; 35 -1,-1.32; 36 -1,1.32; 37 -0.6,-1.32; 38 -0.6,1.32; 39 -0.2,-1.32; 40 -0.2,1.32; 41 0.2,-1.32; 42 0.2,1.32; 43 0.6,-1.32; 44 0.6,1.32; 45 1,-1.32; 46 1,1.32; 47 1.4,-1.32; 48 1.4,1.32; 49 1.8,-1.32; 50 1.8,1.32; 51 2.2,-1.32; 52 2.2,1.32; 53 2.6,-1.32; 54 2.6,1.32; 55 3,-1.32; 56 3,1.32; 57 3.4,-1.32; 58 3.4,1.32; 59 3.8,-1.32; 60 3.8,1.32; 61 4.2,-1.32; 62 4.2,1.32; 63 4.6,-1.32; 64 4.6,1.32; 65 5,-1.32; 66 5,1.32; 67 5.4,-1.32; 68 5.4,1.32; 69 5.8,-1.32; 70 5.8,1.32; 71 6.2,-1.32; 72 6.2,1.32; 73 6.6,-1.32; 74 6.6,1.32; 75 7,-1.32; 76 7,1.32; 77 7.4,-1.32; 78 7.4,1.32; 79 7.8,-1.32; 80 7.8,1.32
FTSH-110-XX-YYY-DV = smd 0.74 x 2.79: 1 -5.715,-2.035; 2 -5.715,2.035; 3 -4.445,-2.035; 4 -4.445,2.035; 5 -3.175,-2.035; 6 -3.175,2.035; 7 -1.905,-2.035; 8 -1.905,2.035; 9 -0.635,-2.035; 10 -0.635,2.035; 11 0.635,-2.035; 12 0.635,2.035; 13 1.905,-2.035; 14 1.905,2.035; 15 3.175,-2.035; 16 3.175,2.035; 17 4.445,-2.035; 18 4.445,2.035; 19 5.715,-2.035; 20 5.715,2.035
1212SMDINDUCTORPACK = smd 5.6 x 3: 1 -0.1,3.91; 2 -0.1,-4.045
A1257H-3P_PACK = smd 0.6 x 2.7: P$1 2.35,5.25; P$2 3.6,5.25; P$3 4.85,5.25 | smd 1 x 2.8: P$4 0.5,1.35; P$5 6.7,1.37
686110188622 = smd 0.6 x 1.9: 1 -4.5,2.825; 2 -3.5,2.825; 3 -2.5,2.825; 4 -1.5,2.825; 5 -0.5,2.825; 6 0.5,2.825; 7 1.5,2.825; 8 2.5,2.825; 9 3.5,2.825; 10 4.5,2.825 | smd 2.1 x 2.8: MP1 -7.65,0.475; MP2 7.65,0.475
1X05 = drill 1.016 long: 1 -5.08,0; 2 -2.54,0; 3 0,0; 4 2.54,0; 5 5.08,0
1X07 = drill 1.016 long: 1 -7.62,0; 2 -5.08,0; 3 -2.54,0; 4 0,0; 5 2.54,0; 6 5.08,0; 7 7.62,0
M0805 = smd 1.3 x 1.6: 1 -0.95,0; 2 0.95,0
E-SWITCH_KS-01Q-01_0 = drill 1.1 pad 1.7 square: 1 2.5,2.5 | drill 1.1 pad 1.7: 2 -2.5,2.5; 3 2.5,-2.5; 4 -2.5,-2.5
TO263-5 = smd 1.067 x 2.159: 1 -3.404,-5.791; 2 -1.702,-5.791; 3 0,-5.791; 4 1.702,-5.791; 5 3.404,-5.791 | smd 10.8 x 10.41: 6 0,2.54

### Placement (x,y rotation side)
1  125.6,35.2 0 top
2  125.7,38.9 0 top
3  125.8,42.6 0 top
4  125.9,46.2 0 top
BATT_+  28.3,3.7 180 top
BATT_-  33.2,3.7 180 top
C1  7.43,115.16 180 top
C3  21.88,97.6 0 top
CAN-H  87.6,4 0 top
CAN-H1  2.1,62.8 0 top
CAN-L  84,4 0 top
CAN-L1  2.1,67.1 0 top
D5  8.53,79.8 0 top
IC1  128.3,6 0 top
J1  141.4,26.49 0 top
J2  141.4,69.68 0 top
J3  118.6,19.9 270 top
L  19.99,114.14 90 top
MOTOR_ROTOR  1.1,42.7 270 top
MOTOR_ZENIT  70.3,1.2 0 top
P1  144.8,95 0 top
P2  144.8,109.8 180 top
PIN1  151.5,59.7 270 top
PIN2  111.3,112.9 90 top
PIN3  122.8,112.9 270 top
R1  135.4,5.9 270 top
R2  139.5,6.3 90 top
ROTOR_POWER+  60.6,4.2 180 top
ROTOR_POWER_-  64.5,4.2 180 top
SW2  149,7.3 0 top
TL_2576-5V  8.32,98.28 0 top
ZENIT_50V  122.5,97.6 0 top
ZENIT_GND  122.6,92.6 0 top
ZENIT_POWER_+  3.2,28.4 180 top
ZENIT_POWER_-  3.2,24.2 180 top

### Tracks (layer width: path | path; a pad name or v marks a point on that pad's centre or on a via)
3V3  (via drill 0.7)
  Top 0.254: v138,65.5 J2.23 138,67.3
  Top 0.61: v111.1,25.6 J3.1 113.89,25.61 v112.5,27 112.5,28.8 113.8,30.1 v130.8,30.1 | P2.1 v149.3,102.5 | IC1.3 123.27,5.37 122.7,4.8 114.2,4.8 107.2,11.8 107.2,21.7 v107.6,22.1 | v145.8,65.5 v138,65.5 133.2,65.5 129.2,69.5 v129.2,76.1
  Route15 0.61: 122.78,107.8 PIN3.6 122.82,107.8
  Bottom 0.61: v107.6,22.1 v111.1,25.6 | v130.8,30.1 141.6,30.1 146.3,34.8 146.3,65 v145.8,65.5 | v129.2,76.1 129.2,90.5 124.6,95.1 120.5,95.1 117.8,97.8 117.8,106.3 119.3,107.8 122.78,107.8 PIN3.6 122.82,107.8 125.7,107.8 126.8,108.9 126.8,118.1 130.6,121.9 134.6,121.9 149.3,107.2 v149.3,102.5
+5V  (via drill 0.7)
  Top 0.61: TL_2576-5V.4 10.02,94.5 v14.7,94.5 | v22.7,122.5 24.04,121.17 L.2 24.04,106.36 v25.3,105.1
  Route15 0.61: v14.7,94.5 14.7,107.5 10,112.2 10,115.13 C1.+ 10,115.19 10,118.4 14.1,122.5 v22.7,122.5 | v25.3,105.1 26.9,103.5 26.9,92 6.8,71.9 6.8,5.2 10.7,1.3 152.7,1.3 155,3.6 155,61.6 154.4,62.2 151.54,62.2 PIN1.2
  pour Route15 (isolate 0.2): -5.3,135.3 161.5,135.3 161.5,-6.4 -5.3,-6.4
BATT+50V  (via drill 0.7)
  Top 0.61: TL_2576-5V.1 4.9,92.47 v4.9,86.2 3.5,84.8 v3.5,79.8 D5.1 | C3.+ 20,97.6 22.6,95 22.6,83.2 | BATT_+.MP v3.6,3.7 0.9,6.4 0.9,29.5 5.1,33.7 5.1,36.2 3.7,37.6 3.7,40.5 4.9,41.7 v4.9,73.9 | 22.6,83.2 22.5,83.2 9.2,69.9 9.2,49.6 v8.9,49.3 | v9.1,31.7 9.1,30.6 6.9,28.4 ZENIT_POWER_+.MP | v101.4,9.2 83.9,9.2 79.7,13.4 65.3,13.4 60.6,8.7 26.1,8.7 22.6,12.2 22.6,37.9 12.9,47.6 12.9,67 22.6,76.7 22.6,80.1 | 6.62,88.81 6.6,88.79 6.62,88.77 | L.1 16.08,106.82 19.34,103.56 C3.+ | ROTOR_POWER+.MP 58.7,6.1 25.7,6.1 20.7,11.1 20.7,36.9 11.1,46.5 11.1,68.6 22.6,80.1 | 22.6,80.1 22.6,83.2 | TL_2576-5V.2 6.62,88.77 | C3.+ 19.3,97.56 19.3,92.3 13.5,86.5 8.8,86.5 6.62,88.68 6.62,88.77
  Bottom 0.61: v9.1,31.7 9.1,49.1 v8.9,49.3 | ZENIT_50V.MP 128,97.6 135.4,90.2 135.4,69.2 134,67.8 134,43.3 115.6,24.9 115.6,23.4 v101.4,9.2 | C3.+ 19.34,92.24 11,83.9 4.9,83.9 | 4.9,83.9 v4.9,73.9 | v4.9,86.2 4.9,83.9
CAN1RX
  Top 0.254: 143.6,23.1 J1.51
  Top 0.61: IC1.4 127.19,4.09 127.5,4.4 127.5,7.2 130.1,9.8 138.7,9.8 143.6,14.7 143.6,23.1
CAN1TX
  Top 0.254: 142.4,22.8 142.4,23.2 143.2,24 J1.49
  Top 0.61: IC1.1 126.11,7.91 129.5,11.3 138.5,11.3 142.4,15.2 142.4,22.8
CS
  Top 0.254: J2.36 140.4,71.9 138.5,73.8 136.3,73.8 136,74.1 133.6,76.6
  Top 0.61: PIN3.2 120.98,117.98 118.9,115.9 118.9,104.6 122.1,101.4 124,101.4 126.9,98.5 126.9,83.3 133.6,76.6
EN_ROT
  Top 0.61: P2.6 P1.5 144.3,96.3 155.1,85.5 155.1,17.6 147.3,9.8 SW2.2
GND  (via drill 0.7)
  Top 0.254: v139.6,22.1 J1.31
  Top 0.61: v2,94.5 8.3,94.5 8.3,92.51 TL_2576-5V.3 8.32,90.18 9.1,89.4 11.67,89.4 v11.72,89.45 TL_2576-5V.5 12.61,92.49 v13.5,91.6 | v10.2,82.4 D5.2 | D5.2 | D5.2 10.2,78.3 v8.4,76.5 | v12.4,37.8 6.4,37.8 MOTOR_ROTOR.P$3 9.85,37.85 v13.4,34.3 | v69.4,11.9 74.32,11.9 75.11,11.11 75.11,6.49 MOTOR_ZENIT.P$3 75.15,9.65 v76.7,11.2 | v121.9,6.62 125.73,6.62 IC1.2 | v110.4,20.5 112.9,20.5 | 112.9,20.5 116.53,20.5 J3.9 113.77,20.54 | J3.3 116.53,24.38 112.78,24.38 | 112.78,24.38 112.7,24.3 112.7,23.2 112.8,23.1 116.54,23.1 J3.5 113.88,23.07 112.8,22 112.8,20.6 112.9,20.5 | 112.78,24.38 111.98,24.38 | 111.98,24.38 v110.5,22.9 | v139.5,3.6 R2.1 140.55,5.35 v141.7,4.2 | 111.98,24.38 109.12,24.38 v108.2,25.4
  Route2 0.61: v2,94.5 2,112.27 C1.- | v13.5,91.6 21,91.6 24.4,95 24.4,97.58 C3.- | v8.4,76.5 8.4,41.3 v12.4,37.8 | v13.4,34.3 13.4,30.1 7.5,24.2 ZENIT_POWER_-.MP 3.2,9.8 7.4,5.6 26.6,5.6 27.2,6.2 30.7,6.2 BATT_-.MP 56.4,3.7 59.1,1 63.7,1 64.5,1.8 ROTOR_POWER_-.MP 64.5,7 v69.4,11.9 | v110.4,20.5 110,20.1 110,10.8 114.18,6.62 v121.9,6.62 119.08,3.8 97.8,3.8 90.4,11.2 v76.7,11.2 | v139.5,3.6 139.3,3.4 128.8,3.4 123.9,8.3 116.3,8.3 112.4,12.2 112.4,21.9 111.4,22.9 v110.5,22.9 | v141.7,4.2 142.9,3 148.3,3 149,3.7 149,8.1 150.7,9.8 SW2.1 151.5,17.5 149.3,19.7 142,19.7 v139.6,22.1 | PIN3.5 122.74,110.3 119.8,110.3 117.2,107.7 117.2,98 ZENIT_GND.MP 124.1,91.1 148.3,91.1 155,84.4 155,41.5 143.6,30.1 111.5,30.1 108.2,26.8 v108.2,25.4 | v11.72,89.45 10.2,87.93 v10.2,82.4
  pour Route2 (isolate 0.1): -3.6,133.8 159.6,133.8 159.6,-4.4 -3.6,-4.4
GPIO2
  Top 0.254: 3.MP 125.9,42.6 | 146,75.3 145.9,75.3 143.2,72.6 J2.50
  Top 0.61: 125.9,42.6 133.8,42.6 147.9,56.7 147.9,64.1 152.3,68.5 152.3,72.3 149.3,75.3 146,75.3
N$1  (via drill 0.6)
  other vias: 5.3,103.7
N$3  (via drill 0.6)
  other vias: 8.3,103.6
N$4  (via drill 0.6)
  other vias: 11.5,103.5
N$5  (via drill 0.6)
  other vias: 5.3,100.2
N$6  (via drill 0.6)
  other vias: 8.3,100.2
N$7  (via drill 0.6)
  other vias: 11.5,100.2
N$8  (via drill 0.6)
  other vias: 11.4,97.2
N$9  (via drill 0.6)
  other vias: 8.3,97.2
N$10  (via drill 0.6)
  other vias: 5.3,97.2
N$12
  Top 0.61: CAN-H.MP 90.2,4 92,2.2 126.9,2.2 128.5,3.8 128.5,6.3 128.8,6.6 130.81,6.6 IC1.7 130.87,6.65 133.03,6.65 133.23,6.85 R1.1
  Bottom 0.61: CAN-H1.MP 2.1,30.7 0.8,29.4 0.8,3.5 3.1,1.2 84.8,1.2 CAN-H.MP
N$13
  Top 0.61: CAN-L.MP 84,3.2 86,1.2 133.6,1.2 135.4,3 R1.2 132.88,4.95 132.45,5.38 130.87,5.38 IC1.6
  Bottom 0.61: CAN-L1.MP 2.9,67.1 5.4,64.6 5.4,12 11.3,6.1 81.9,6.1 CAN-L.MP
N$15
  Top 0.61: IC1.8 132.71,7.91 133.3,8.5 138.25,8.5 R2.2
PWM6
  Top 0.254: 147.8,74.2 147.3,74.2 145.6,72.5 J2.62
  Top 0.61: 4.MP 135.5,46.2 146.8,57.5 146.8,64.3 151.2,68.7 151.2,72.1 149.1,74.2 147.8,74.2
RESET  (via drill 0.7)
  Top 0.254: J1.73 148,24.1 v147.3,23.4
  Top 0.61: v128.97,20.52 120.65,20.52 J3.10
  Bottom 0.61: v128.97,20.52 144.42,20.52 v147.3,23.4
ROTOR_RX_ROT  (via drill 0.7)
  Top 0.61: MOTOR_ROTOR.P$2 14.1,39.1 v16.2,37 | v151.6,83.2 142.3,92.5 P1.3 P2.8
  Bottom 0.61: v16.2,37 16.2,15.6 24.6,7.2 89.9,7.2 96.1,1 152.8,1 155.1,3.3 155.1,79.7 v151.6,83.2
ROTOR_TX_ROT  (via drill 0.7)
  Top 0.61: P2.9 P1.2 141.3,89.8 v150.4,80.7 | MOTOR_ROTOR.P$1 15.15,40.35 v18.8,36.7
  Bottom 0.61: v18.8,36.7 18.8,16.2 26.2,8.8 90.8,8.8 97.2,2.4 152.1,2.4 153.8,4.1 153.8,47.8 148.4,53.2 148.4,67.8 153.5,72.9 153.5,77.6 v150.4,80.7
SAO
  Top 0.254: J2.40 141.2,72.7 139.1,74.8 137.9,74.8 137.6,75.1 137.6,82.7
  Top 0.61: 137.6,82.7 137.6,85.1 134.6,88.1 134.6,115.9 129.98,120.52 PIN3.1
SCL
  Top 0.254: J2.38 140.8,72.2 138.7,74.3 137.4,74.3 136.4,75.3 136.4,84.2
  Top 0.61: 136.4,84.2 132.5,88.1 132.5,110.3 129.9,112.9 PIN3.4
SDA  (via drill 0.7)
  Top 0.254: J2.42 141.6,73.2 139.7,75.1 v139.7,76.3 | 122.84,115.4 PIN3.3
  Top 0.61: v131.1,115.4 122.84,115.4
  Bottom 0.61: v131.1,115.4 131.4,115.4 137.5,109.3 137.5,87.4 139.7,85.2 v139.7,76.3
TCK/SWCLK  (via drill 0.7)  (1 unrouted)
  Top 0.254: J1.77 148.8,22.4 v149.5,21.7
  Top 0.61: v125.08,24.36 120.65,24.36 J3.4
  Bottom 0.61: 125.2,24.24 125.2,19.9 128,17.1 144.9,17.1 v149.5,21.7
TDO/SWO  (via drill 0.7)
  Top 0.254: J1.79 149.2,24.6 v150.7,23.1 | 120.71,23 J3.6
  Top 0.61: v123.7,23 120.71,23
  Bottom 0.61: v123.7,23 123.7,18.9 127.1,15.5 146.4,15.5 150.7,19.8 v150.7,23.1
TMS/SWDIO  (via drill 0.7)
  Top 0.254: J1.75 148.4,22.8 v147.3,21.7
  Top 0.61: v126.3,25.6 120.65,25.6 J3.2
  Bottom 0.61: v126.3,25.6 126.3,21 128.6,18.7 144.3,18.7 v147.3,21.7
UART0-RX
  Top 0.254: 140,31.5 J1.34
  Top 0.61: 1.MP 136.3,35.2 140,31.5
UART0-TX
  Top 0.254: 140.8,33.1 140.8,29.5 140.4,29.1 J1.36
  Top 0.61: 2.MP 135,38.9 140.8,33.1
ZENIT_RX_ROT  (via drill 0.7)
  Top 0.61: P2.7 P1.4 143.3,94.3 v144.5,93.1 | MOTOR_ZENIT.P$2 v73.9,10.2
  Bottom 0.61: v73.9,10.2 73.9,10.5 76.3,12.9 91.1,12.9 100.4,3.6 117.7,3.6 120.1,6 120.1,23.4 143.7,47 143.7,92.3 v144.5,93.1
ZENIT_TX_ROT  (via drill 0.7)
  Top 0.254: 140.2,97.72 P1.1
  Top 0.61: P2.10 P1.1 | MOTOR_ZENIT.P$1 72.65,8.35 v70.9,10.1 | 140.2,97.72 v140.2,87.8
  Bottom 0.61: v70.9,10.1 70.9,11.3 73.8,14.2 91.8,14.2 101.2,4.8 116.3,4.8 118.3,6.8 118.3,24.2 141.6,47.5 141.6,86.4 v140.2,87.8

### Text on the board
tNames: 50V_zenit_POWER + | C1 | 330UF | ROTOR-KHAMEX-K1 | SAO | SOX | CS | SCX | SDA | P2 | INT1 | SCL | INT2 | GND | TL_12-V. | L | OCS | 3V3 | VIN | P1 | C3 | 100UF | D5 | VIN-5V | PWM6 | GPIO2 | UART0-TX | UART0-RX | MOTOR +50V | MOTOR - | RESET | ROT_POWER + | ROT_POWER - | BAT + | BAT -